# Altium schematic sheet ffultra_connectors.SchDoc: FFultra Connectors
size A4; DrawnBy: Michael Mannis; SheetNumber: 6; SheetTotal: 13
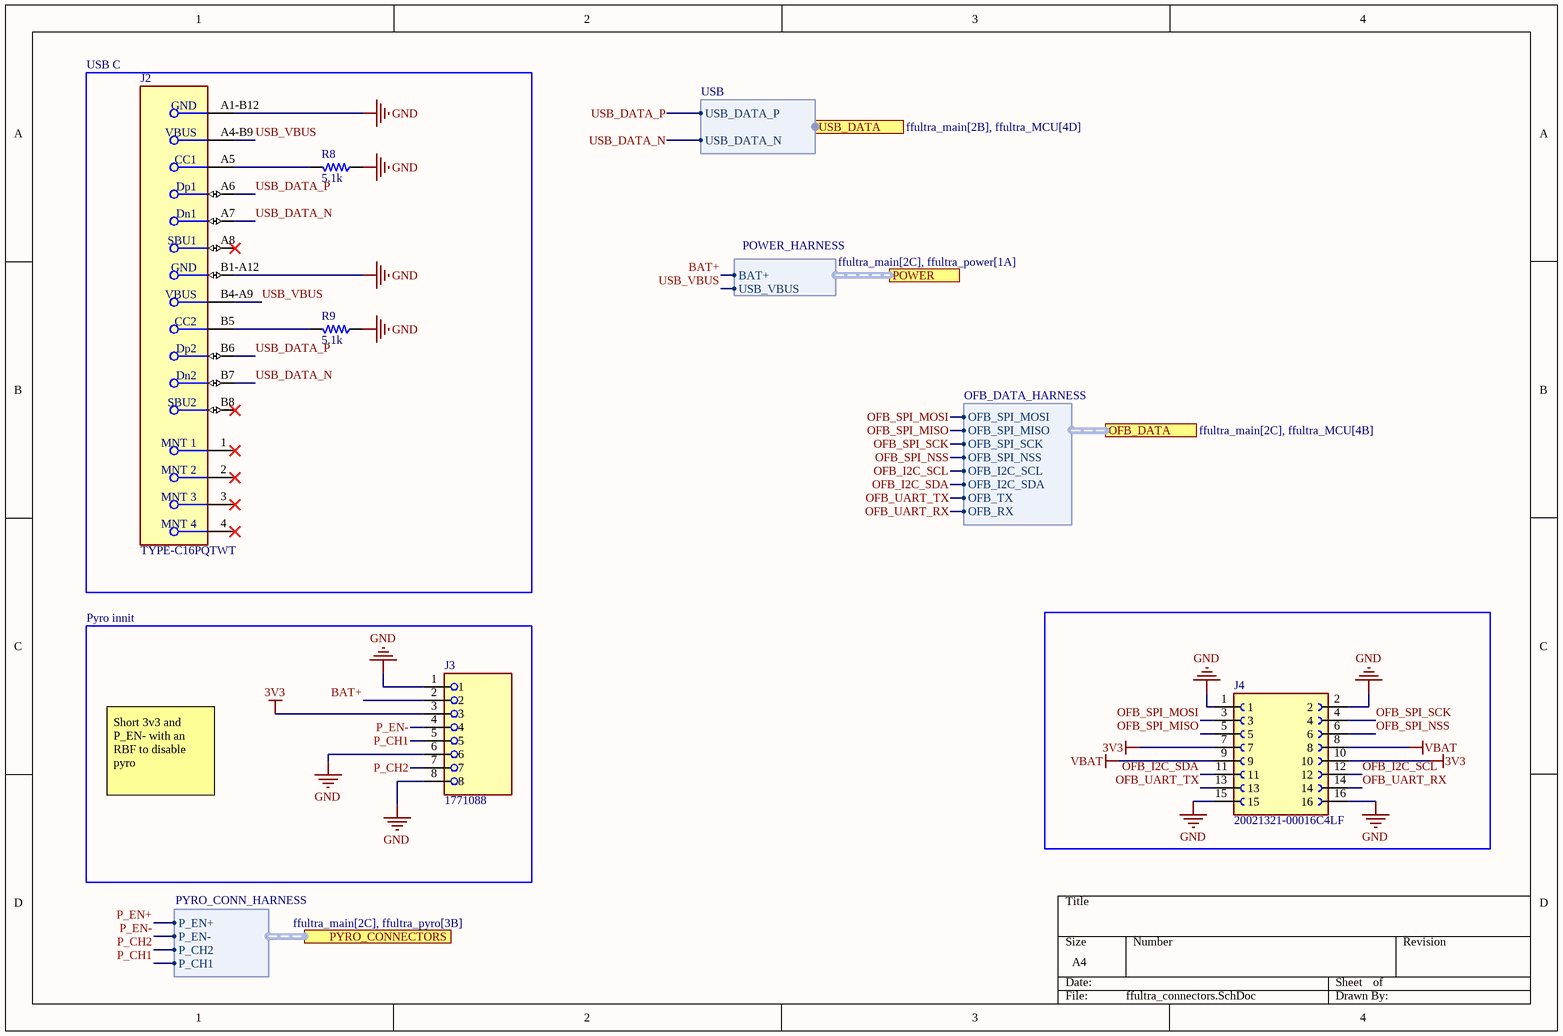
[diagram p0: ffultra_connectors.SchDoc]

## Parts
J2  TYPE-C16PQTWT  [FP-USB4110-GF-A-MFG]
J3  1771088  [PHOENIX_1771088]  (no BOM)
J4  20021321-00016C4LF  [AMPHENOL_20021321-00016C4LF]  (no BOM)
R8  value 5.1k  [RES-0402]  (hidden comment: 0402WGF5101TCE)
R9  value 5.1k  [RES-0402]  (hidden comment: 0402WGF5101TCE)

## Blocks framed on the sheet
USB C: J2 R8 R9
Pyro innit: J3

## Ports
OFB_DATA (harness OFB_DATA_HARNESS, see ffultra_main[2C], ffultra_MCU[4B]), POWER (harness POWER_HARNESS, see ffultra_main[2C], ffultra_power[1A]), PYRO_CONNECTORS (harness PYRO_CONN_HARNESS, see ffultra_main[2C], ffultra_pyro[3B]), USB_DATA (harness USB, see ffultra_main[2B], ffultra_MCU[4D])

## Harnesses
PYRO_CONN_HARNESS: P_CH1, P_CH2, P_EN+, P_EN-
POWER_HARNESS: BAT+, USB_VBUS
USB: USB_DATA_P, USB_DATA_N
OFB_DATA_HARNESS: OFB_SPI_MOSI, OFB_SPI_MISO, OFB_SPI_SCK, OFB_I2C_SCL, OFB_I2C_SDA, OFB_SPI_NSS, OFB_TX, OFB_RX

## Nets
3V3: J3.3 J4.7 J4.10
GND: J2.A1-B12(GND) J2.B1-A12(GND) J3.1 J3.6 J3.8 J4.1 J4.2 J4.15 J4.16 R8.1 R9.1
VBAT: J4.8 J4.9
BAT+: J3.2 ; port POWER.BAT+
OFB_I2C_SCL: J4.12 ; port OFB_DATA.OFB_I2C_SCL
OFB_I2C_SDA: J4.11 ; port OFB_DATA.OFB_I2C_SDA
OFB_SPI_MISO: J4.5 ; port OFB_DATA.OFB_SPI_MISO
OFB_SPI_MOSI: J4.3 ; port OFB_DATA.OFB_SPI_MOSI
OFB_SPI_NSS: J4.6 ; port OFB_DATA.OFB_SPI_NSS
OFB_SPI_SCK: J4.4 ; port OFB_DATA.OFB_SPI_SCK
OFB_UART_RX: J4.14 ; port OFB_DATA.OFB_RX
OFB_UART_TX: J4.13 ; port OFB_DATA.OFB_TX
P_CH1: J3.5 ; port PYRO_CONNECTORS.P_CH1
P_CH2: J3.7 ; port PYRO_CONNECTORS.P_CH2
P_EN+: port PYRO_CONNECTORS.P_EN+
P_EN-: J3.4 ; port PYRO_CONNECTORS.P_EN-
USB_DATA_N: J2.A7(Dn1) J2.B7(Dn2) ; port USB_DATA.USB_DATA_N
USB_DATA_P: J2.A6(Dp1) J2.B6(Dp2) ; port USB_DATA.USB_DATA_P
USB_VBUS: J2.A4-B9(VBUS) J2.B4-A9(VBUS) ; port POWER.USB_VBUS
NetJ2_A5: J2.A5(CC1) R8.2
NetJ2_B5: J2.B5(CC2) R9.2

Not connected (* = marked no-connect by the designer): J2 1(MNT_1)* 2(MNT_2)* 3(MNT_3)* 4(MNT_4)* A8(SBU1)* B8(SBU2)*

## Notes on the sheet
- Short 3v3 and P_EN- with an RBF to disable pyro

## Library data of the parts
J2 = CMP-002-00099-1: USB Connector, 16 Contact(s), Male, Right Angle, Surface Mount Terminal, Locking, Receptacle; JLCPCB Part Number: C5187472
J3 = CMP-153-000000-4: PTSM 0,5/ 8-2,5-H SMD R44 - PCB terminal block; Manufacturer: Phoenix Contact; MP: 1771088; Pin Count: 8; Design Item ID: 1771088
J4 = CMP-161-000000-3: Pin Count: 16; Design Item ID: 20021321-00016C4LF; Value: *; MP: 20021321-00016C4LF; Source: 20021321-00016C4LF.SchLib; Package: None; Availability: Unavailable; Component Type: Standard; Price: None; JLCPCB Part Number: C5413697
R8 R9 = CMP-009-00235-1: Resistor, 5.1kΩ, ±1%, 62.5mW, 50V, ±100ppm/℃, -55℃~+155℃, SMD 0402; Manufacturer: Uniroyal; Temperature Coefficient: ±100ppm/℃; ComponentLink1URL: https://datasheet.lcsc.com/lcsc/2206010045_UNI-ROYAL-Uniroyal-Elec-0402WGF5101TCE_C25905.pdf; Design Item ID: 0402WGF5101TCE; JLCPCB Basic Part: Yes; Category: Resistors; Tolerance: 1%; Power Rating: 62.5mW; Voltage Rating: 50V; JLCPCB Part Number: C25905; Case/Package: 0402; Temperature Rating: -55℃~+155℃; Source: jlcpcb_resistors_basic.schlib; Manufacturer Part Number: 0402WGF5101TCE; ComponentLink1Description: Datasheet; ComponentLink2Description: JLCPCB Part URL; ComponentLink2URL: https://jlcpcb.com/partdetail/C25905